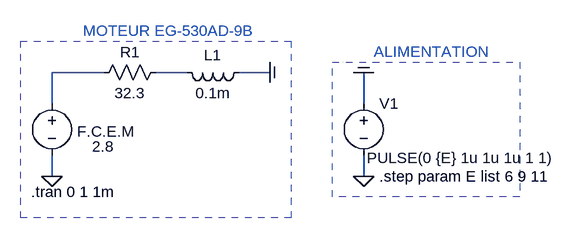
[diagram p0: schematic model_moteurDC.asc]
model_moteurDC.asc, the LTspice schematic file:
Version 4.1
SHEET 1 880 680
WIRE 96 96 16 96
WIRE 224 96 176 96
WIRE 352 96 304 96
WIRE 16 144 16 96
WIRE 496 144 496 96
WIRE 16 256 16 224
WIRE 496 256 496 224
FLAG 16 256 0
FLAG 352 96 COM
FLAG 496 256 0
FLAG 496 96 COM
SYMBOL voltage 16 128 R0
WINDOW 0 39 59 Left 2
WINDOW 3 62 82 Left 2
WINDOW 123 0 0 Left 0
WINDOW 39 0 0 Left 0
SYMATTR InstName F.C.E.M
SYMATTR Value 2.8
SYMBOL res 192 80 R90
WINDOW 0 0 56 VBottom 2
WINDOW 3 32 56 VTop 2
SYMATTR InstName R1
SYMATTR Value 32.3
SYMBOL ind 320 80 R90
WINDOW 0 5 56 VBottom 2
WINDOW 3 32 56 VTop 2
SYMATTR InstName L1
SYMATTR Value 0.1m
SYMBOL voltage 496 128 R0
WINDOW 3 5 100 Left 2
WINDOW 123 0 0 Left 0
WINDOW 39 0 0 Left 0
SYMATTR Value PULSE(0 {E} 1u 1u 1u 1 1)
SYMATTR InstName V1
TEXT -16 280 Left 2 !.tran 0 1 1m
TEXT 520 256 Left 2 !.step param E list 6 9 11
TEXT 64 32 Left 2 ;MOTEUR EG-530AD-9B
TEXT 512 64 Left 2 ;ALIMENTATION
RECTANGLE Normal 448 96 448 96 2
RECTANGLE Normal 464 80 464 80 2
RECTANGLE Normal 736 288 448 80 2
RECTANGLE Normal 384 320 -32 48 2

The netlist it stands for:
* model_moteurDC.asc
V§F.C.E.M N001 0 2.8
R1 N002 N001 32.3
L1 COM N002 0.1m
V1 COM 0 PULSE(0 {E} 1u 1u 1u 1 1)
.tran 0 1 1m
.step param E list 6 9 11
* MOTEUR EG-530AD-9B
* ALIMENTATION
.backanno
.end